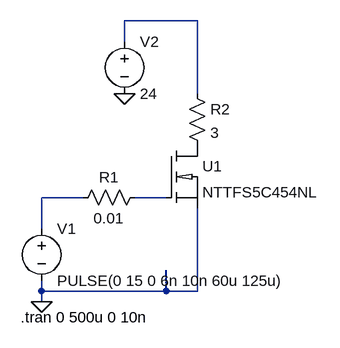
[diagram p0: schematic GateDrive.asc]
GateDrive.asc, the LTspice schematic file:
Version 4
SHEET 1 880 680
WIRE -336 -320 -448 -320
WIRE -448 -288 -448 -320
WIRE -336 -208 -336 -320
WIRE -512 -48 -576 -48
WIRE -384 -48 -432 -48
WIRE -576 0 -576 -48
WIRE -576 96 -576 80
WIRE -384 96 -384 64
WIRE -384 96 -576 96
WIRE -336 96 -336 -32
WIRE -336 96 -384 96
WIRE -576 112 -576 96
FLAG -576 112 0
FLAG -448 -208 0
SYMBOL voltage -576 -16 R0
WINDOW 123 0 0 Left 0
WINDOW 39 0 0 Left 0
SYMATTR InstName V1
SYMATTR Value PULSE(0 15 0 6n 10n 60u 125u)
SYMBOL res -416 -64 R90
WINDOW 0 0 56 VBottom 2
WINDOW 3 32 56 VTop 2
SYMATTR InstName R1
SYMATTR Value 0.01
SYMBOL NTTFS5C454NL -384 -128 R0
SYMATTR InstName U1
SYMBOL res -352 -224 R0
SYMATTR InstName R2
SYMATTR Value 3
SYMBOL voltage -448 -304 R0
SYMATTR InstName V2
SYMATTR Value 24
TEXT -608 136 Left 2 !.tran 0 500u 0 10n

The netlist it stands for:
* GateDrive.asc
V1 N002 0 PULSE(0 15 0 6n 10n 60u 125u)
R1 N003 N002 0.01
XU1 P001 N003 0 NTTFS5C454NL NTTFS5C454NL  ; pins D G S
R2 N001 P001 3
V2 N001 0 24
.tran 0 500u 0 10n
.lib NTTFS5C454NL.lib
.backanno
.end